# Altium schematic sheet USB_OTG.SchDoc (part 2 of 4)
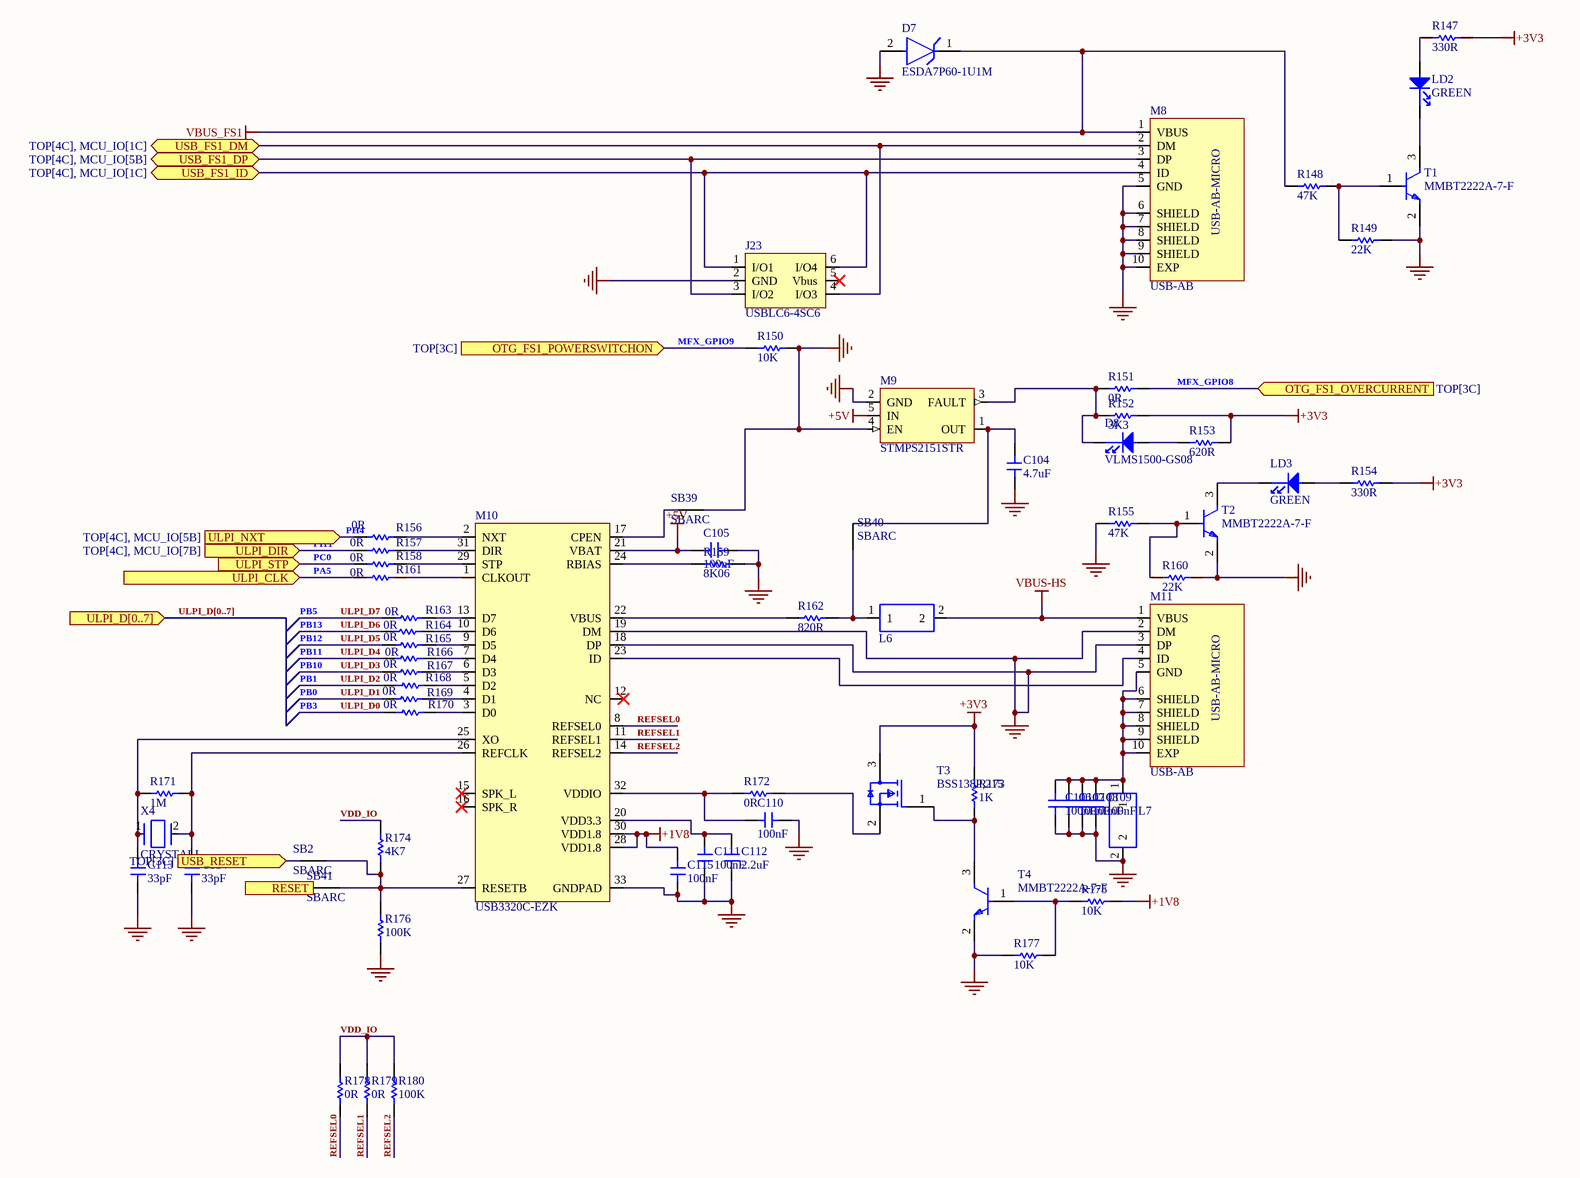
[diagram p1: USB_OTG.SchDoc]
## Library data of the parts
C104 = CL05A475MO5NUNC: 16V 4.7uF X5R 卤20% 0402 Multilayer Ceramic Capacitors MLCC - SMD/SMT ROHS; Manufacturer: Samsung Electro-Mechanics; Value: 4.7µF; Tolerance: 20%; Supplier: DigiKey; Supplier Part Number: 1276-6836-6-ND; Manufacturer Part Number: CL05A475MO5NUNC; RoHS: Compliant; Category: Ceramic Capacitors; Stock: 1005448; Pricing: 1=0.43, 10=0.26, 50=0.1918, 100=0.1709, 500=0.13574 (USD); Case/Package: 0402; Case Code (Imperial): 0402; Case Code (Metric): 1005; China RoHS: Compliant; Dielectric: X5R; Dielectric Material: Ceramic; Height: 500µm; Length: 1mm; Lifecycle Status: Production; Material: Ceramic; Max Operating Temperature: 85°C; Min Operating Temperature: -55°C; Mounting Technology: Surface Mount; Number of Terminals: 2; REACH SVHC: Yes; Schedule B: 8532240020, 8532240020|8532240020, 8532240020|8532240020|8532240020, 8532240020|8532240020|8532240020|8532240020; Thickness: 558.8µm; Voltage Rating: 16V; Voltage Rating (DC): 16V; Width: 500µm; ComponentLink1URL: https://datasheet.octopart.com:443/CL05A475MO5NUNC-Samsung-Electro-Mechanics-datasheet-178175196.pdf?src-supplier=Farnell; ComponentLink1Description: https://datasheet.octopart.com:443/CL05A475MO5NUNC-Samsung-Electro-Mechanics-datasheet-178175196.pdf?src-supplier=Farnell; ComponentLink2URL: https://datasheet.octopart.com:443/CL05A475MO5NUNC-Samsung-Electro-Mechanics-datasheet-123102911.pdf?src-supplier=Future+Electronics; ComponentLink2Description: https://datasheet.octopart.com:443/CL05A475MO5NUNC-Samsung-Electro-Mechanics-datasheet-123102911.pdf?src-supplier=Future+Electronics; ComponentLink3URL: https://datasheet.octopart.com:443/CL05A475MO5NUNC-Samsung-Electro-Mechanics-datasheet-110226225.pdf?src-supplier=Future+Electronics; ComponentLink3Description: https://datasheet.octopart.com:443/CL05A475MO5NUNC-Samsung-Electro-Mechanics-datasheet-110226225.pdf?src-supplier=Future+Electronics; ComponentLink4URL: https://datasheet.octopart.com:443/CL05A475MO5NUNC-Samsung-Electro-Mechanics-datasheet-83567908.pdf?src-supplier=Future+Electronics; ComponentLink4Description: https://datasheet.octopart.com:443/CL05A475MO5NUNC-Samsung-Electro-Mechanics-datasheet-83567908.pdf?src-supplier=Future+Electronics; ComponentLink5URL: https://datasheet.octopart.com:443/CL05A475MO5NUNC-Samsung-Electro-Mechanics-datasheet-68297032.pdf?src-supplier=Future+Electronics; ComponentLink5Description: https://datasheet.octopart.com:443/CL05A475MO5NUNC-Samsung-Electro-Mechanics-datasheet-68297032.pdf?src-supplier=Future+Electronics; ComponentLink6URL: https://datasheet.octopart.com:443/CL05A475MO5NUNC-Samsung-Electro-Mechanics-datasheet-87580057.pdf?src-supplier=Future+Electronics; ComponentLink6Description: https://datasheet.octopart.com:443/CL05A475MO5NUNC-Samsung-Electro-Mechanics-datasheet-87580057.pdf?src-supplier=Future+Electronics; ComponentLink7URL: https://datasheet.octopart.com:443/CL05A475MO5NUNC-Samsung-Electro-Mechanics-datasheet-149136694.pdf?src-supplier=Future+Electronics; ComponentLink7Description: https://datasheet.octopart.com:443/CL05A475MO5NUNC-Samsung-Electro-Mechanics-datasheet-149136694.pdf?src-supplier=Future+Electronics
C105-C111 C115 = CC0402KRX7R7BB104: 16V 100nF X7R ±10% 0402 Multilayer Ceramic Capacitors MLCC - SMD/SMT ROHS; Manufacturer: Yageo Group; Temperature Coefficient: 30ppm/°C; Supplier: DigiKey; Supplier Part Number: 311-1338-6-ND; Manufacturer Part Number: CC0402KRX7R7BB104; RoHS: Compliant; Category: Ceramic Capacitors; Stock: 6066978; Pricing: 1=0.1, 10=0.034, 50=0.0224, 100=0.0191, 500=0.01342 (USD); Value: 100nF; Case/Package: 0402; Case Code (Imperial): 0402; Case Code (Metric): 1005; China RoHS: Compliant; Composition: Ceramic; Country of Origin: Mainland China, Taiwan; Depth: 500µm; Dielectric: X7R; Dielectric Material: Ceramic; Export Control Classification Number (ECCN) Code: EAR99; Halogen Free: Halogen Free; Height: 500µm; Harmonized Tariff Schedule (HTS) Code: 8532.24.00.20; Introduction Date: 2009-04-17; Lead Free: Lead Free; Length: 1mm; Lifecycle Status: Production; Material: Ceramic; Max Operating Temperature: 125°C; Min Operating Temperature: -55°C; Mounting Technology: Surface Mount; Pins: 2; Number of Terminals: 2; Radiation Hardening: No; REACH SVHC: Yes; Schedule B: 8532240020, 8532240020|8532240020, 8532240020|8532240020|8532240020, 8532240020|8532240020|8532240020|8532240020; Termination: SMD/SMT; Thickness: 558.8µm; Tolerance: 10%; Voltage: 16V; Voltage Rating: 16V; Voltage Rating (AC): 16V; Voltage Rating (DC): 16V; Width: 500µm; ComponentLink1URL: https://datasheet.octopart.com:443/CC0402KRX7R7BB104-Yageo-datasheet-177165144.pdf?src-supplier=IHS; ComponentLink1Description: https://datasheet.octopart.com:443/CC0402KRX7R7BB104-Yageo-datasheet-177165144.pdf?src-supplier=IHS; ComponentLink2URL: https://datasheet.octopart.com/CC0402KRX7R7BB104-Yageo-datasheet-10883670.pdf; ComponentLink2Description: https://datasheet.octopart.com/CC0402KRX7R7BB104-Yageo-datasheet-10883670.pdf; ComponentLink3URL: https://datasheet.octopart.com/CC0402KRX7R7BB104-Yageo-datasheet-12526321.pdf; ComponentLink3Description: https://datasheet.octopart.com/CC0402KRX7R7BB104-Yageo-datasheet-12526321.pdf; ComponentLink4URL: https://datasheet.octopart.com:443/CC0402KRX7R7BB104-Yageo-datasheet-82288757.pdf?src-supplier=Upverter; ComponentLink4Description: https://datasheet.octopart.com:443/CC0402KRX7R7BB104-Yageo-datasheet-82288757.pdf?src-supplier=Upverter; ComponentLink5URL: https://datasheet.octopart.com:443/CC0402KRX7R7BB104-Yageo-datasheet-78855684.pdf?src-supplier=Upverter; ComponentLink5Description: https://datasheet.octopart.com:443/CC0402KRX7R7BB104-Yageo-datasheet-78855684.pdf?src-supplier=Upverter; ComponentLink6URL: https://datasheet.octopart.com:443/CC0402KRX7R7BB104-Yageo-datasheet-68298032.pdf?src-supplier=Upverter; ComponentLink6Description: https://datasheet.octopart.com:443/CC0402KRX7R7BB104-Yageo-datasheet-68298032.pdf?src-supplier=Upverter; ComponentLink7URL: https://datasheet.octopart.com:443/CC0402KRX7R7BB104-Yageo-datasheet-181967370.pdf?src-supplier=Newark; ComponentLink7Description: https://datasheet.octopart.com:443/CC0402KRX7R7BB104-Yageo-datasheet-181967370.pdf?src-supplier=Newark; ComponentLink8URL: https://datasheet.octopart.com:443/CC0402KRX7R7BB104-Yageo-datasheet-181967368.pdf?src-supplier=Newark; ComponentLink8Description: https://datasheet.octopart.com:443/CC0402KRX7R7BB104-Yageo-datasheet-181967368.pdf?src-supplier=Newark; ComponentLink9URL: https://datasheet.octopart.com:443/CC0402KRX7R7BB104-Yageo-datasheet-499490.pdf?src-supplier=Newark; ComponentLink9Description: https://datasheet.octopart.com:443/CC0402KRX7R7BB104-Yageo-datasheet-499490.pdf?src-supplier=Newark; ComponentLink10URL: https://datasheet.octopart.com:443/CC0402KRX7R7BB104-Yageo-datasheet-519481.pdf?src-supplier=Newark; ComponentLink10Description: https://datasheet.octopart.com:443/CC0402KRX7R7BB104-Yageo-datasheet-519481.pdf?src-supplier=Newark; ComponentLink11URL: https://datasheet.octopart.com:443/CC0402KRX7R7BB104-Yageo-datasheet-182050774.pdf?src-supplier=Newark; ComponentLink11Description: https://datasheet.octopart.com:443/CC0402KRX7R7BB104-Yageo-datasheet-182050774.pdf?src-supplier=Newark; ComponentLink12URL: https://datasheet.octopart.com:443/CC0402KRX7R7BB104-Yageo-datasheet-62336348.pdf?src-supplier=Farnell; ComponentLink12Description: https://datasheet.octopart.com:443/CC0402KRX7R7BB104-Yageo-datasheet-62336348.pdf?src-supplier=Farnell; ComponentLink13URL: https://datasheet.octopart.com:443/CC0402KRX7R7BB104-Yageo-datasheet-151948686.pdf?src-supplier=Farnell; ComponentLink13Description: https://datasheet.octopart.com:443/CC0402KRX7R7BB104-Yageo-datasheet-151948686.pdf?src-supplier=Farnell; ComponentLink14URL: https://datasheet.octopart.com:443/CC0402KRX7R7BB104-Yageo-Group-datasheet-188689702.pdf?src-supplier=Farnell; ComponentLink14Description: https://datasheet.octopart.com:443/CC0402KRX7R7BB104-Yageo-Group-datasheet-188689702.pdf?src-supplier=Farnell; ComponentLink15URL: https://datasheet.octopart.com:443/CC0402KRX7R7BB104-Yageo-datasheet-8359971.pdf?src-supplier=Farnell; ComponentLink15Description: https://datasheet.octopart.com:443/CC0402KRX7R7BB104-Yageo-datasheet-8359971.pdf?src-supplier=Farnell; ComponentLink16URL: https://datasheet.octopart.com:443/CC0402KRX7R7BB104-Yageo-datasheet-500777.pdf?src-supplier=Farnell; ComponentLink16Description: https://datasheet.octopart.com:443/CC0402KRX7R7BB104-Yageo-datasheet-500777.pdf?src-supplier=Farnell; ComponentLink17URL: https://datasheet.octopart.com:443/CC0402KRX7R7BB104-Yageo-datasheet-137700084.pdf?src-supplier=Burklin+Elektronik; ComponentLink17Description: https://datasheet.octopart.com:443/CC0402KRX7R7BB104-Yageo-datasheet-137700084.pdf?src-supplier=Burklin+Elektronik; ComponentLink18URL: https://datasheet.octopart.com:443/CC0402KRX7R7BB104-Yageo-datasheet-27626582.pdf?src-supplier=Future+Electronics; ComponentLink18Description: https://datasheet.octopart.com:443/CC0402KRX7R7BB104-Yageo-datasheet-27626582.pdf?src-supplier=Future+Electronics; ComponentLink19URL: https://datasheet.octopart.com:443/CC0402KRX7R7BB104-Yageo-datasheet-166511530.pdf?src-supplier=Future+Electronics; ComponentLink19Description: https://datasheet.octopart.com:443/CC0402KRX7R7BB104-Yageo-datasheet-166511530.pdf?src-supplier=Future+Electronics; ComponentLink20URL: https://datasheet.octopart.com:443/CC0402KRX7R7BB104-Yageo-datasheet-137700082.pdf?src-supplier=Future+Electronics; ComponentLink20Description: https://datasheet.octopart.com:443/CC0402KRX7R7BB104-Yageo-datasheet-137700082.pdf?src-supplier=Future+Electronics; ComponentLink21URL: https://datasheet.octopart.com:443/CC0402KRX7R7BB104-Yageo-datasheet-24578986.pdf?src-supplier=Future+Electronics; ComponentLink21Description: https://datasheet.octopart.com:443/CC0402KRX7R7BB104-Yageo-datasheet-24578986.pdf?src-supplier=Future+Electronics; ComponentLink22URL: https://datasheet.octopart.com:443/CC0402KRX7R7BB104-Yageo-datasheet-10911834.pdf?src-supplier=Future+Electronics; ComponentLink22Description: https://datasheet.octopart.com:443/CC0402KRX7R7BB104-Yageo-datasheet-10911834.pdf?src-supplier=Future+Electronics; ComponentLink23URL: https://datasheet.octopart.com:443/CC0402KRX7R7BB104-Yageo-datasheet-8324442.pdf?src-supplier=Future+Electronics; ComponentLink23Description: https://datasheet.octopart.com:443/CC0402KRX7R7BB104-Yageo-datasheet-8324442.pdf?src-supplier=Future+Electronics; ComponentLink24URL: https://datasheet.octopart.com:443/CC0402KRX7R7BB104-Yageo-datasheet-15895757.pdf?src-supplier=element14+APAC; ComponentLink24Description: https://datasheet.octopart.com:443/CC0402KRX7R7BB104-Yageo-datasheet-15895757.pdf?src-supplier=element14+APAC; ComponentLink25URL: https://datasheet.octopart.com:443/CC0402KRX7R7BB104-Yageo-Group-datasheet-184163374.pdf?src-supplier=LCSC; ComponentLink25Description: https://datasheet.octopart.com:443/CC0402KRX7R7BB104-Yageo-Group-datasheet-184163374.pdf?src-supplier=LCSC; ComponentLink26URL: https://datasheet.octopart.com:443/CC0402KRX7R7BB104-Yageo-Group-datasheet-165992755.pdf?src-supplier=ODG+(Origin+Data+Global); ComponentLink26Description: https://datasheet.octopart.com:443/CC0402KRX7R7BB104-Yageo-Group-datasheet-165992755.pdf?src-supplier=ODG+(Origin+Data+Global); ComponentLink27URL: https://datasheet.octopart.com:443/CC0402KRX7R7BB104-Yageo-datasheet-140260305.pdf?src-supplier=SOS+electronic; ComponentLink27Description: https://datasheet.octopart.com:443/CC0402KRX7R7BB104-Yageo-datasheet-140260305.pdf?src-supplier=SOS+electronic; ComponentLink28URL: https://datasheet.octopart.com:443/CC0402KRX7R7BB104-Yageo-datasheet-151978998.pdf?src-supplier=SOS+electronic; ComponentLink28Description: https://datasheet.octopart.com:443/CC0402KRX7R7BB104-Yageo-datasheet-151978998.pdf?src-supplier=SOS+electronic; ComponentLink29URL: https://datasheet.octopart.com:443/CC0402KRX7R7BB104-Yageo-datasheet-8701427.pdf?src-supplier=element14; ComponentLink29Description: https://datasheet.octopart.com:443/CC0402KRX7R7BB104-Yageo-datasheet-8701427.pdf?src-supplier=element14; ComponentLink30URL: https://datasheet.octopart.com:443/CC0402KRX7R7BB104-Yageo-datasheet-5301394.pdf?src-supplier=element14; ComponentLink30Description: https://datasheet.octopart.com:443/CC0402KRX7R7BB104-Yageo-datasheet-5301394.pdf?src-supplier=element14; ComponentLink31URL: http://sigma.octopart.com:80/rohs_statement/Surface-Mount-Ceramic-Multilayer-Capacitors%3B-General-Purpose-%26-High-Capacitance-Class-2%2C-X7R-Yageo-family-124.pdf?src-supplier=Compliance+Statements; ComponentLink31Description: http://sigma.octopart.com:80/rohs_statement/Surface-Mount-Ceramic-Multilayer-Capacitors%3B-General-Purpose-%26-High-Capacitance-Class-2%2C-X7R-Yageo-family-124.pdf?src-supplier=Compliance+Statements; ComponentLink32URL: http://sigma.octopart.com:80/reach_statement/Surface-Mount-Ceramic-Multilayer-Capacitors%3B-General-Purpose-%26-High-Capacitance-Class-2%2C-X7R-Yageo-family-125.pdf?src-supplier=Compliance+Statements; ComponentLink32Description: http://sigma.octopart.com:80/reach_statement/Surface-Mount-Ceramic-Multilayer-Capacitors%3B-General-Purpose-%26-High-Capacitance-Class-2%2C-X7R-Yageo-family-125.pdf?src-supplier=Compliance+Statements; ComponentLink33URL: http://sigma.octopart.com:80/conflict_mineral_statement/Yageo-company-3.pdf?src-supplier=Compliance+Statements; ComponentLink33Description: http://sigma.octopart.com:80/conflict_mineral_statement/Yageo-company-3.pdf?src-supplier=Compliance+Statements; ComponentLink34URL: http://sigma.octopart.com:80/rohs_statement/Yageo-company-2.pdf?src-supplier=Compliance+Statements; ComponentLink34Description: http://sigma.octopart.com:80/rohs_statement/Yageo-company-2.pdf?src-supplier=Compliance+Statements
C112 = CC1206KKX7R7BB225: Surface Mount Ceramic Multilayer Capacitor 2.2uF 10% X7R 16V 1206 Blister T/R; Manufacturer: Yageo Group; Value: 2.2µF; Supplier: DigiKey; Supplier Part Number: 311-1957-1-ND; Manufacturer Part Number: CC1206KKX7R7BB225; RoHS: Compliant; Category: Ceramic Capacitors; Stock: 35949; Pricing: 1=0.38, 10=0.221, 50=0.1606, 100=0.1421, 500=0.11082 (USD); Case/Package: 1206; Case Code (Imperial): 1206; Case Code (Metric): 3216; China RoHS: Compliant; Depth: 1.6mm; Dielectric: X7R; Dielectric Material: Ceramic; Halogen Free: Halogen Free; Height: 1.15mm; Lead Free: Lead Free; Length: 3.2mm; Lifecycle Status: Production; Material: Ceramic; Max Operating Temperature: 125°C; Min Operating Temperature: -55°C; Mounting Technology: Surface Mount; Pins: 2; Number of Terminals: 2; Packaging: Tape and Reel; Radiation Hardening: No; REACH SVHC: Yes; Schedule B: 8532240020, 8532240020|8532240020|8532240020|8532240020|8532240020; Termination: SMD/SMT; Thickness: 1.2446mm; Tolerance: 10%; Voltage: 16V; Voltage Rating: 16V; Voltage Rating (DC): 16V; Width: 1.6mm; ComponentLink1URL: https://datasheet.octopart.com:443/CC1206KKX7R7BB225-Yageo-datasheet-177165144.pdf?src-supplier=IHS; ComponentLink1Description: https://datasheet.octopart.com:443/CC1206KKX7R7BB225-Yageo-datasheet-177165144.pdf?src-supplier=IHS; ComponentLink2URL: https://datasheet.octopart.com:443/CC1206KKX7R7BB225-Yageo-datasheet-116051370.pdf?src-supplier=Upverter; ComponentLink2Description: https://datasheet.octopart.com:443/CC1206KKX7R7BB225-Yageo-datasheet-116051370.pdf?src-supplier=Upverter; ComponentLink3URL: https://datasheet.octopart.com:443/CC1206KKX7R7BB225-Yageo-datasheet-82288757.pdf?src-supplier=Upverter; ComponentLink3Description: https://datasheet.octopart.com:443/CC1206KKX7R7BB225-Yageo-datasheet-82288757.pdf?src-supplier=Upverter; ComponentLink4URL: https://datasheet.octopart.com:443/CC1206KKX7R7BB225-Yageo-datasheet-147453679.pdf?src-supplier=Farnell; ComponentLink4Description: https://datasheet.octopart.com:443/CC1206KKX7R7BB225-Yageo-datasheet-147453679.pdf?src-supplier=Farnell; ComponentLink5URL: https://datasheet.octopart.com:443/CC1206KKX7R7BB225-Yageo-datasheet-181970700.pdf?src-supplier=Farnell; ComponentLink5Description: https://datasheet.octopart.com:443/CC1206KKX7R7BB225-Yageo-datasheet-181970700.pdf?src-supplier=Farnell; ComponentLink6URL: https://datasheet.octopart.com:443/CC1206KKX7R7BB225-Yageo-datasheet-140260305.pdf?src-supplier=element14+APAC; ComponentLink6Description: https://datasheet.octopart.com:443/CC1206KKX7R7BB225-Yageo-datasheet-140260305.pdf?src-supplier=element14+APAC; ComponentLink7URL: https://datasheet.octopart.com/CC1206KKX7R7BB225-Yageo-datasheet-12526321.pdf; ComponentLink7Description: https://datasheet.octopart.com/CC1206KKX7R7BB225-Yageo-datasheet-12526321.pdf; ComponentLink8URL: https://datasheet.octopart.com/CC1206KKX7R7BB225-Yageo-datasheet-10883670.pdf; ComponentLink8Description: https://datasheet.octopart.com/CC1206KKX7R7BB225-Yageo-datasheet-10883670.pdf; ComponentLink9URL: https://datasheet.octopart.com:443/CC1206KKX7R7BB225-Yageo-Group-datasheet-189192896.pdf?src-supplier=Future+Electronics; ComponentLink9Description: https://datasheet.octopart.com:443/CC1206KKX7R7BB225-Yageo-Group-datasheet-189192896.pdf?src-supplier=Future+Electronics; ComponentLink10URL: https://datasheet.octopart.com:443/CC1206KKX7R7BB225-Yageo-datasheet-166511530.pdf?src-supplier=Future+Electronics; ComponentLink10Description: https://datasheet.octopart.com:443/CC1206KKX7R7BB225-Yageo-datasheet-166511530.pdf?src-supplier=Future+Electronics; ComponentLink11URL: https://datasheet.octopart.com:443/CC1206KKX7R7BB225-Yageo-datasheet-137700082.pdf?src-supplier=Future+Electronics; ComponentLink11Description: https://datasheet.octopart.com:443/CC1206KKX7R7BB225-Yageo-datasheet-137700082.pdf?src-supplier=Future+Electronics; ComponentLink12URL: https://datasheet.octopart.com:443/CC1206KKX7R7BB225-Yageo-datasheet-137700084.pdf?src-supplier=Future+Electronics; ComponentLink12Description: https://datasheet.octopart.com:443/CC1206KKX7R7BB225-Yageo-datasheet-137700084.pdf?src-supplier=Future+Electronics; ComponentLink13URL: https://datasheet.octopart.com:443/CC1206KKX7R7BB225-Yageo-datasheet-27626582.pdf?src-supplier=Future+Electronics; ComponentLink13Description: https://datasheet.octopart.com:443/CC1206KKX7R7BB225-Yageo-datasheet-27626582.pdf?src-supplier=Future+Electronics; ComponentLink14URL: https://datasheet.octopart.com:443/CC1206KKX7R7BB225-Yageo-datasheet-15895757.pdf?src-supplier=Future+Electronics; ComponentLink14Description: https://datasheet.octopart.com:443/CC1206KKX7R7BB225-Yageo-datasheet-15895757.pdf?src-supplier=Future+Electronics; ComponentLink15URL: https://datasheet.octopart.com:443/CC1206KKX7R7BB225-Yageo-datasheet-10911834.pdf?src-supplier=Future+Electronics; ComponentLink15Description: https://datasheet.octopart.com:443/CC1206KKX7R7BB225-Yageo-datasheet-10911834.pdf?src-supplier=Future+Electronics; ComponentLink16URL: https://datasheet.octopart.com:443/CC1206KKX7R7BB225-Yageo-datasheet-12523175.pdf?src-supplier=Future+Electronics; ComponentLink16Description: https://datasheet.octopart.com:443/CC1206KKX7R7BB225-Yageo-datasheet-12523175.pdf?src-supplier=Future+Electronics; ComponentLink17URL: https://datasheet.octopart.com:443/CC1206KKX7R7BB225-Yageo-datasheet-8324442.pdf?src-supplier=Future+Electronics; ComponentLink17Description: https://datasheet.octopart.com:443/CC1206KKX7R7BB225-Yageo-datasheet-8324442.pdf?src-supplier=Future+Electronics; ComponentLink18URL: https://datasheet.octopart.com:443/CC1206KKX7R7BB225-Yageo-Group-datasheet-184163374.pdf?src-supplier=LCSC; ComponentLink18Description: https://datasheet.octopart.com:443/CC1206KKX7R7BB225-Yageo-Group-datasheet-184163374.pdf?src-supplier=LCSC; ComponentLink19URL: https://datasheet.octopart.com:443/CC1206KKX7R7BB225-Yageo-Group-datasheet-165992755.pdf?src-supplier=ODG+(Origin+Data+Global); ComponentLink19Description: https://datasheet.octopart.com:443/CC1206KKX7R7BB225-Yageo-Group-datasheet-165992755.pdf?src-supplier=ODG+(Origin+Data+Global); ComponentLink20URL: https://datasheet.octopart.com:443/CC1206KKX7R7BB225-Yageo-datasheet-151948686.pdf?src-supplier=TME; ComponentLink20Description: https://datasheet.octopart.com:443/CC1206KKX7R7BB225-Yageo-datasheet-151948686.pdf?src-supplier=TME; ComponentLink21URL: https://datasheet.octopart.com:443/CC1206KKX7R7BB225-Yageo-datasheet-17600895.pdf?src-supplier=TME; ComponentLink21Description: https://datasheet.octopart.com:443/CC1206KKX7R7BB225-Yageo-datasheet-17600895.pdf?src-supplier=TME; ComponentLink22URL: https://datasheet.octopart.com:443/CC1206KKX7R7BB225-Yageo-datasheet-62336348.pdf?src-supplier=Newark; ComponentLink22Description: https://datasheet.octopart.com:443/CC1206KKX7R7BB225-Yageo-datasheet-62336348.pdf?src-supplier=Newark; ComponentLink23URL: http://sigma.octopart.com:80/rohs_statement/Surface-Mount-Ceramic-Multilayer-Capacitors%3B-General-Purpose-%26-High-Capacitance-Class-2%2C-X7R-Yageo-family-124.pdf?src-supplier=Compliance+Statements; ComponentLink23Description: http://sigma.octopart.com:80/rohs_statement/Surface-Mount-Ceramic-Multilayer-Capacitors%3B-General-Purpose-%26-High-Capacitance-Class-2%2C-X7R-Yageo-family-124.pdf?src-supplier=Compliance+Statements; ComponentLink24URL: http://sigma.octopart.com:80/reach_statement/Surface-Mount-Ceramic-Multilayer-Capacitors%3B-General-Purpose-%26-High-Capacitance-Class-2%2C-X7R-Yageo-family-125.pdf?src-supplier=Compliance+Statements; ComponentLink24Description: http://sigma.octopart.com:80/reach_statement/Surface-Mount-Ceramic-Multilayer-Capacitors%3B-General-Purpose-%26-High-Capacitance-Class-2%2C-X7R-Yageo-family-125.pdf?src-supplier=Compliance+Statements; ComponentLink25URL: http://sigma.octopart.com:80/conflict_mineral_statement/Yageo-company-3.pdf?src-supplier=Compliance+Statements; ComponentLink25Description: http://sigma.octopart.com:80/conflict_mineral_statement/Yageo-company-3.pdf?src-supplier=Compliance+Statements; ComponentLink26URL: http://sigma.octopart.com:80/rohs_statement/Yageo-company-2.pdf?src-supplier=Compliance+Statements; ComponentLink26Description: http://sigma.octopart.com:80/rohs_statement/Yageo-company-2.pdf?src-supplier=Compliance+Statements
C113 C114 = 0402YK330FBSTR\500: Cap Silicon 33pF 16V 0±60ppm/C 1% SMD 0402 125C Automotive T/R; Manufacturer: KYOCERA AVX; Material: Ceramic; Temperature Coefficient: 60ppm/°C; Supplier: DigiKey; Supplier Part Number: 478-12128-6-ND; Manufacturer Part Number: 0402YK330FBSTR\500; RoHS: Compliant; Category: Film Capacitors; Stock: 15880; Pricing: 1=1.05, 10=0.676, 50=0.527, 100=0.4811 (USD); Value: 33pF; Case/Package: 0402; China RoHS: Compliant; Height: 400µm; Length: 1mm; Lifecycle Status: Production; Max Operating Temperature: 125°C; Min Operating Temperature: -55°C; Mounting Technology: Surface Mount; Number of Terminals: 2; REACH SVHC: Yes; Schedule B: 8532290040, 8532290040|8532290040|8532290040|8532290040|8532290040; Tolerance: 1%; Voltage Rating: 16V; Voltage Rating (DC): 16V; Width: 550µm; ComponentLink1URL: https://datasheet.octopart.com:443/0402YK330FBSTR%5C500-KYOCERA-AVX-datasheet-158242086.pdf?src-supplier=IHS; ComponentLink1Description: https://datasheet.octopart.com:443/0402YK330FBSTR%5C500-KYOCERA-AVX-datasheet-158242086.pdf?src-supplier=IHS; ComponentLink2URL: https://datasheet.octopart.com:443/0402YK330FBSTR%5C500-AVX-datasheet-152583363.pdf?src-supplier=Upverter; ComponentLink2Description: https://datasheet.octopart.com:443/0402YK330FBSTR%5C500-AVX-datasheet-152583363.pdf?src-supplier=Upverter; ComponentLink3URL: http://sigma.octopart.com:80/conflict_mineral_statement/AVX-company-34.pdf?src-supplier=Compliance+Statements; ComponentLink3Description: http://sigma.octopart.com:80/conflict_mineral_statement/AVX-company-34.pdf?src-supplier=Compliance+Statements; ComponentLink4URL: http://sigma.octopart.com:80/reach_statement/AVX-company-19.pdf?src-supplier=Compliance+Statements; ComponentLink4Description: http://sigma.octopart.com:80/reach_statement/AVX-company-19.pdf?src-supplier=Compliance+Statements
D7 = ESDA7P60-1U1M: ESDA Series 6.4 V 700 W SMT Uni-Directional TVS Diode - 1610; Manufacturer: STMicroelectronics; Breakdown Voltage: 6.8V; Clamping Voltage: 11.6V; Direction: Unidirectional; Max Breakdown Voltage: 7.2V; Max Junction Temperature (Tj): 150°C; Min Breakdown Voltage: 6.4V; Number of Channels: 1; Peak Pulse Current: 60A; Peak Pulse Power: 700W; Peak Reverse Current: 200nA; Power Line Protection: No; Reverse Standoff Voltage: 5V; Supplier: DigiKey; Supplier Part Number: 497-16253-6-ND; Manufacturer Part Number: ESDA7P60-1U1M; RoHS: Compliant; Category: TVS Diodes; Stock: 60851; Pricing: 1=0.54, 10=0.33, 50=0.2392, 100=0.2096, 500=0.15722 (USD); Case/Package: 1610; China RoHS: Compliant; Composition: Zener; Country of Origin: Mainland China; Export Control Classification Number (ECCN) Code: EAR99; Height: 650µm; Harmonized Tariff Schedule (HTS) Code: 8541.10.00.50; Introduction Date: 2014-11-14; Lifecycle Status: Production; Max Operating Temperature: 150°C; Min Operating Temperature: -55°C; Mounting Technology: Surface Mount; Number of Elements: 1; Pins: 2; Number of Terminals: 2; Number of Unidirectional Channels: 1; Polarity: Unidirectional; REACH SVHC: Yes; Schedule B: 8536300000, 8536300000|8536300000, 8536300000|8536300000|8536300000, 8536300000|8536300000|8536300000|8536300000; ComponentLink1URL: https://datasheet.octopart.com:443/ESDA7P60-1U1M-STMicroelectronics-datasheet-62313013.pdf?src-supplier=Upverter; ComponentLink1Description: https://datasheet.octopart.com:443/ESDA7P60-1U1M-STMicroelectronics-datasheet-62313013.pdf?src-supplier=Upverter; ComponentLink2URL: https://datasheet.octopart.com:443/ESDA7P60-1U1M-STMicroelectronics-datasheet-34136856.pdf?src-supplier=STMicroelectronics; ComponentLink2Description: https://datasheet.octopart.com:443/ESDA7P60-1U1M-STMicroelectronics-datasheet-34136856.pdf?src-supplier=STMicroelectronics
D8 = VLMS1500-GS08: LED Uni-Color Super Red 639nm 2-Pin Chip 0402(1006Metric) T/R
J23 = USBLC6-4SC6: STMicroelectronics USBLC6-4SC6 Diode TVS USBLC6-4SC6 Tape Reel Surge Protection; Breakdown Voltage: 8V; Value: 3pF; Clamping Voltage: 17V; Direction: Unidirectional; ESD Protection: Yes; Forward Voltage: 860mV; Interface: Ethernet, USB; Leakage Current: 150nA; Max Breakdown Voltage: 10V; Max Junction Temperature (Tj): 125°C; Max Reverse Leakage Current: 2µA; Min Breakdown Voltage: 6V; Number of Bidirectional Channels: 4; Number of Elements: 1; Peak Pulse Current: 5A; Peak Pulse Power: 130W; Reverse Standoff Voltage: 5V; Test Current: 1mA; Supplier: DigiKey; Supplier Part Number: 497-4492-2-ND; Manufacturer: STMicroelectronics; Manufacturer Part Number: USBLC6-4SC6; RoHS: Compliant; Category: TVS Diodes; Stock: 34382; Pricing: 3000=0.13528, 9000=0.11686 (USD); Case/Package: SOT-23; China RoHS: Compliant; Contact Plating: Tin; Depth: 1.75mm; Height: 1.45mm; Lead Free: Lead Free; Length: 3mm; Lifecycle Status: Production; Max Operating Temperature: 125°C; Min Operating Temperature: -40°C; Mounting Technology: Surface Mount; Number of Channels: 4; Pins: 6; Number of Terminals: 6; Operating Supply Voltage: 860mV; Packaging: Cut Tape; Peak Reverse Current: 150nA; Polarity: Unidirectional; Power Line Protection: Yes; Radiation Hardening: No; REACH SVHC: Yes; Reverse Breakdown Voltage: 6V; Schedule B: 8536300000, 8536300000|8536300000|8536300000|8536300000|8536300000; Termination: SMD/SMT; Voltage Rating (DC): 5V; Weight: 4.535924g; Width: 1.75mm; Working Voltage: 5V; ComponentLink1URL: https://datasheet.octopart.com:443/USBLC6-4SC6-STMicroelectronics-datasheet-10411966.pdf?src-supplier=Upverter; ComponentLink1Description: https://datasheet.octopart.com:443/USBLC6-4SC6-STMicroelectronics-datasheet-10411966.pdf?src-supplier=Upverter; ComponentLink2URL: https://datasheet.octopart.com:443/USBLC6-4SC6-STMicroelectronics-datasheet-58295097.pdf?src-supplier=Future+Electronics; ComponentLink2Description: https://datasheet.octopart.com:443/USBLC6-4SC6-STMicroelectronics-datasheet-58295097.pdf?src-supplier=Future+Electronics; ComponentLink3URL: https://datasheet.octopart.com:443/USBLC6-4SC6-STMicroelectronics-datasheet-5415472.pdf?src-supplier=Factory+Futures; ComponentLink3Description: https://datasheet.octopart.com:443/USBLC6-4SC6-STMicroelectronics-datasheet-5415472.pdf?src-supplier=Factory+Futures; ComponentLink4URL: https://datasheet.octopart.com:443/USBLC6-4SC6-STMicroelectronics-datasheet-93958.pdf?src-supplier=Nu+Horizons; ComponentLink4Description: https://datasheet.octopart.com:443/USBLC6-4SC6-STMicroelectronics-datasheet-93958.pdf?src-supplier=Nu+Horizons; ComponentLink5URL: https://datasheet.octopart.com:443/USBLC6-4SC6-STMicroelectronics-datasheet-14050649.pdf?src-supplier=iiiC; ComponentLink5Description: https://datasheet.octopart.com:443/USBLC6-4SC6-STMicroelectronics-datasheet-14050649.pdf?src-supplier=iiiC; ComponentLink6URL: https://datasheet.octopart.com:443/USBLC6-4SC6-STMicroelectronics-datasheet-8428582.pdf?src-supplier=Jameco+(USA); ComponentLink6Description: https://datasheet.octopart.com:443/USBLC6-4SC6-STMicroelectronics-datasheet-8428582.pdf?src-supplier=Jameco+(USA); ComponentLink7URL: https://datasheet.octopart.com:443/USBLC6-4SC6-STMicroelectronics-datasheet-46285.pdf?src-supplier=Farnell; ComponentLink7Description: https://datasheet.octopart.com:443/USBLC6-4SC6-STMicroelectronics-datasheet-46285.pdf?src-supplier=Farnell
L6 L7 = FBMJ1608HM180NTR: Ferrite Beads Power Chip 18Ohm 30% 100MHz 7.5A 0.004Ohm DCR 0603 Automotive T/R; Manufacturer: TAIYO YUDEN; DC Resistance (DCR): 4mΩ; Impedance: 18Ω; Number of Circuits: 1; Value: 4mΩ; Supplier: DigiKey; Supplier Part Number: 587-3251-6-ND; Manufacturer Part Number: FBMJ1608HM180NTR; RoHS: Compliant; Category: Ferrite Beads and Chips; Stock: 36635; Pricing: 1=0.12, 10=0.085, 25=0.0744, 50=0.0666, 100=0.0596, 250=0.05132, 500=0.04556, 1000=0.04024 (USD); Case/Package: 0603; Case Code (Imperial): 0603; Case Code (Metric): 1608; Current Rating: 7.5A; Halogen Free: Halogen Free; Height: 800µm; Length: 1.6mm; Lifecycle Status: Production; Max Current Rating: 7.5A; Max DC Current: 7.5A; Clock Frequency: 100MHz; Max Length: 1.8mm; Max Operating Temperature: 125°C; Max Thickness: 1mm; Max Width: 1mm; Min Length: 1.4mm; Min Operating Temperature: -40°C; Min Thickness: 600µm; Min Width: 600µm; Mounting Technology: Surface Mount; Number of Lines: 1; Number of Terminals: 2; Packaging: Cut Tape (CT); REACH SVHC: Yes; Termination: SMD/SMT; Test Frequency: 100MHz; Tolerance: 30%; Weight: 2.012816mg; Width: 800µm; ComponentLink1URL: https://datasheet.octopart.com:443/FBMJ1608HM180NTR-Taiyo-Yuden-datasheet-151884371.pdf?src-supplier=IHS; ComponentLink1Description: https://datasheet.octopart.com:443/FBMJ1608HM180NTR-Taiyo-Yuden-datasheet-151884371.pdf?src-supplier=IHS; ComponentLink2URL: https://datasheet.octopart.com:443/FBMJ1608HM180NTR-Taiyo-Yuden-datasheet-154808389.pdf?src-supplier=Master+Electronics; ComponentLink2Description: https://datasheet.octopart.com:443/FBMJ1608HM180NTR-Taiyo-Yuden-datasheet-154808389.pdf?src-supplier=Master+Electronics; ComponentLink3URL: https://datasheet.octopart.com:443/FBMJ1608HM180NTR-Taiyo-Yuden-datasheet-112254974.pdf?src-supplier=Newark; ComponentLink3Description: https://datasheet.octopart.com:443/FBMJ1608HM180NTR-Taiyo-Yuden-datasheet-112254974.pdf?src-supplier=Newark; ComponentLink4URL: https://datasheet.octopart.com:443/FBMJ1608HM180NTR-Taiyo-Yuden-datasheet-99833420.pdf?src-supplier=Future+Electronics; ComponentLink4Description: https://datasheet.octopart.com:443/FBMJ1608HM180NTR-Taiyo-Yuden-datasheet-99833420.pdf?src-supplier=Future+Electronics; ComponentLink5URL: https://datasheet.octopart.com/FBMJ1608HM180NTR-Taiyo-Yuden-datasheet-17272611.pdf; ComponentLink5Description: https://datasheet.octopart.com/FBMJ1608HM180NTR-Taiyo-Yuden-datasheet-17272611.pdf
LD2 LD3 = led_green: LED
M8 M11 = 105017-0001: Conn Micro USB 2.0 Type B RCP 5 POS 0.65mm Solder RA SMD 5 Terminal 1 Port Micro-USB T/R; Manufacturer: Molex; Manufacturer Lifecycle Status: ACTIVE; Connector Type: Receptacle, USB; Contact Resistance: 30mΩ; Current Rating: 2.5A; Dielectric Material: Liquid Crystal Polymer; Gender: Female; Insulation Resistance: 1GΩ; Max Voltage Rating (AC): 30V; Number of Circuits: 5; Number of Ports: 1; Pitch: 650µm; Plating: Gold; USB Standard: USB 2.0; Supplier: DigiKey; Supplier Part Number: WM1399CT-ND; Manufacturer Part Number: 105017-0001; RoHS: Compliant; Category: USB Connectors; Stock: 55178; Pricing: 1=0.92, 10=0.785, 25=0.7356, 50=0.7004, 100=0.667, 250=0.62516, 500=0.59532, 1000=0.56688 (USD); China RoHS: Compliant; Contact Material: Brass; Contact Plating: Gold; Country of Origin: US; Depth: 7.5mm; Export Control Classification Number (ECCN) Code: EAR99; Features: Shielded; Halogen Free: Low Halogen; Height: 2.825mm; Housing Material: Polymer; Harmonized Tariff Schedule (HTS) Code: 8536.69.40.30; Insulation Color: Black; Introduction Date: 2009-06-22; Length: 8.2mm; Lifecycle Status: Production; Max Operating Temperature: 85°C; Min Operating Temperature: -30°C; Mounting Technology: Cable; Number of Contacts: 5; Pins: 5; Number of Positions: 5; Number of Rows: 1; Number of Terminals: 5; Orientation: Right Angle; Radiation Hardening: No; REACH SVHC: Yes; Schedule B: 8536695050, 8536695050|8536695050, 8536695050|8536695050|8536695050, 8536695050|8536695050|8536695050|8536695050; Shell Finish: Tin; Shell Material: Stainless Steel; Terminal Pitch: 650µm; Termination: Solder; Voltage Rating: 30V; Voltage Rating (AC): 30V; ComponentLink1URL: https://datasheet.octopart.com:443/1050170001-Molex-datasheet-142335147.pdf?src-supplier=IHS; ComponentLink1Description: https://datasheet.octopart.com:443/1050170001-Molex-datasheet-142335147.pdf?src-supplier=IHS; ComponentLink2URL: https://datasheet.octopart.com:443/105017-0001-Molex-datasheet-14876665.pdf?src-supplier=Upverter; ComponentLink2Description: https://datasheet.octopart.com:443/105017-0001-Molex-datasheet-14876665.pdf?src-supplier=Upverter; ComponentLink3URL: https://datasheet.octopart.com:443/105017-0001-Molex-datasheet-10100431.pdf?src-supplier=Upverter; ComponentLink3Description: https://datasheet.octopart.com:443/105017-0001-Molex-datasheet-10100431.pdf?src-supplier=Upverter; ComponentLink4URL: https://datasheet.octopart.com:443/1050170001-Molex-datasheet-8355809.pdf?src-supplier=Upverter; ComponentLink4Description: https://datasheet.octopart.com:443/1050170001-Molex-datasheet-8355809.pdf?src-supplier=Upverter; ComponentLink5URL: https://sigma.octopart.com:443/120074112/technical_drawing/Molex-1050170001.pdf?src-supplier=Upverter; ComponentLink5Description: https://sigma.octopart.com:443/120074112/technical_drawing/Molex-1050170001.pdf?src-supplier=Upverter; ComponentLink6URL: https://datasheet.octopart.com:443/105017-0001-Molex-datasheet-13746511.pdf?src-supplier=Sager+Electronics; ComponentLink6Description: https://datasheet.octopart.com:443/105017-0001-Molex-datasheet-13746511.pdf?src-supplier=Sager+Electronics; ComponentLink7URL: https://datasheet.octopart.com:443/105017-0001-Molex-datasheet-193058816.pdf?src-supplier=JRH+Electronics; ComponentLink7Description: https://datasheet.octopart.com:443/105017-0001-Molex-datasheet-193058816.pdf?src-supplier=JRH+Electronics; ComponentLink8URL: https://datasheet.octopart.com:443/105017-0001-Molex-datasheet-154742999.pdf?src-supplier=Master+Electronics; ComponentLink8Description: https://datasheet.octopart.com:443/105017-0001-Molex-datasheet-154742999.pdf?src-supplier=Master+Electronics; ComponentLink9URL: https://datasheet.octopart.com:443/105017-0001-Molex-datasheet-77519180.pdf?src-supplier=Newark; ComponentLink9Description: https://datasheet.octopart.com:443/105017-0001-Molex-datasheet-77519180.pdf?src-supplier=Newark; ComponentLink10URL: https://datasheet.octopart.com:443/105017-0001-Molex-datasheet-66628043.pdf?src-supplier=Newark; ComponentLink10Description: https://datasheet.octopart.com:443/105017-0001-Molex-datasheet-66628043.pdf?src-supplier=Newark; ComponentLink11URL: https://datasheet.octopart.com:443/105017-0001-Molex-datasheet-32867472.pdf?src-supplier=Farnell; ComponentLink11Description: https://datasheet.octopart.com:443/105017-0001-Molex-datasheet-32867472.pdf?src-supplier=Farnell; ComponentLink12URL: https://datasheet.octopart.com:443/105017-0001-Molex-datasheet-24907595.pdf?src-supplier=Farnell; ComponentLink12Description: https://datasheet.octopart.com:443/105017-0001-Molex-datasheet-24907595.pdf?src-supplier=Farnell; ComponentLink13URL: https://datasheet.octopart.com:443/105017-0001-Molex-datasheet-140174740.pdf?src-supplier=RS+(Formerly+Allied+Electronics); ComponentLink13Description: https://datasheet.octopart.com:443/105017-0001-Molex-datasheet-140174740.pdf?src-supplier=RS+(Formerly+Allied+Electronics); ComponentLink14URL: https://datasheet.octopart.com:443/105017-0001-Molex-datasheet-120135174.pdf?src-supplier=RS+(Formerly+Allied+Electronics); ComponentLink14Description: https://datasheet.octopart.com:443/105017-0001-Molex-datasheet-120135174.pdf?src-supplier=RS+(Formerly+Allied+Electronics); ComponentLink15URL: https://datasheet.octopart.com:443/1050170001-Molex-datasheet-137316104.pdf?src-supplier=Future+Electronics; ComponentLink15Description: https://datasheet.octopart.com:443/1050170001-Molex-datasheet-137316104.pdf?src-supplier=Future+Electronics; ComponentLink16URL: https://datasheet.octopart.com:443/105017-0001-Molex-datasheet-44399914.pdf?src-supplier=Electro+Sonic; ComponentLink16Description: https://datasheet.octopart.com:443/105017-0001-Molex-datasheet-44399914.pdf?src-supplier=Electro+Sonic; ComponentLink17URL: https://datasheet.octopart.com:443/105017-0001-Molex-datasheet-41578275.pdf?src-supplier=Electro+Sonic; ComponentLink17Description: https://datasheet.octopart.com:443/105017-0001-Molex-datasheet-41578275.pdf?src-supplier=Electro+Sonic; ComponentLink18URL: https://datasheet.octopart.com:443/105017-0001-Molex-datasheet-23708332.pdf?src-supplier=Electro+Sonic; ComponentLink18Description: https://datasheet.octopart.com:443/105017-0001-Molex-datasheet-23708332.pdf?src-supplier=Electro+Sonic; ComponentLink19URL: http://sigma.octopart.com:80/16324173/rohs_statement/Molex-105017-0001.pdf?src-supplier=Compliance+Statements; ComponentLink19Description: http://sigma.octopart.com:80/16324173/rohs_statement/Molex-105017-0001.pdf?src-supplier=Compliance+Statements; ComponentLink20URL: http://sigma.octopart.com:80/reach_statement/Molex-company-74.pdf?src-supplier=Compliance+Statements; ComponentLink20Description: http://sigma.octopart.com:80/reach_statement/Molex-company-74.pdf?src-supplier=Compliance+Statements; ComponentLink21URL: http://sigma.octopart.com:80/rohs_statement/Molex-company-73.pdf?src-supplier=Compliance+Statements; ComponentLink21Description: http://sigma.octopart.com:80/rohs_statement/Molex-company-73.pdf?src-supplier=Compliance+Statements; ComponentLink22URL: http://sigma.octopart.com:80/conflict_mineral_statement/Molex-company-72.pdf?src-supplier=Compliance+Statements; ComponentLink22Description: http://sigma.octopart.com:80/conflict_mineral_statement/Molex-company-72.pdf?src-supplier=Compliance+Statements
M9 = STMPS2151STR: STMPS Series 1 Channel 5.5V 500 mA 200 mOhm High Side Power Switch - SOT-23-5; Manufacturer: STMicroelectronics; Current: 500mA; Drain to Source Resistance: 90mΩ; Fault Protection: Over Temperature, Reverse Current; Max Junction Temperature (Tj): 125°C; Max Power Dissipation: 33.8mW; Max Supply Current: 40µA; Min Input Voltage: 2.7V; Nominal Supply Voltage: 5V; Nominal Supply Current: 12µA; Number of Channels: 1; Power Dissipation: 32.5mW; Value: 90mΩ; Turn-Off Delay Time: 10ms; Turn-On Delay Time: 5ms; Supplier: DigiKey; Supplier Part Number: 497-6934-1-ND; Manufacturer Part Number: STMPS2151STR; RoHS: Compliant; Category: Power Switch ICs - Power Distribution; Pricing: 1=0.73, 10=0.517, 25=0.464, 100=0.406, 250=0.37836, 500=0.36168, 1000=0.34794 (USD); Ambient Temperature Range High: 85°C; Case/Package: LSSOP; China RoHS: Compliant; Country of Origin: Malaysia; Current Rating: 500mA; Export Control Classification Number (ECCN) Code: EAR99; Height: 1.45mm; Height - Seated (Max): 1.45mm; Harmonized Tariff Schedule (HTS) Code: 8542.39.00.60; Introduction Date: 2007-08-01; Lead Free: Lead Free; Length: 2.9mm; Lifecycle Status: Production; Max Supply Voltage: 5.5V; Max Operating Temperature: 85°C; Max Output current: 500mA; Min Operating Temperature: -40°C; Min Supply Voltage: 2.7V; Mounting Technology: Surface Mount; Nominal Supply Voltage (DC): 5V; Number of Circuits: 1; Number of Inputs: 1; Number of Outputs: 1; Pins: 5; Number of Terminals: 5; On-State Resistance: 90mΩ; Operating Supply Voltage: 5.5V; Output Configuration: High Side; Output Current: 500mA; Output Voltage: 5V; Radiation Hardening: No; REACH SVHC: Yes; Schedule B: 8542390000; Terminal Pitch: 950µm; Voltage: 5.5V; Width: 1.625mm; ComponentLink1URL: https://datasheet.octopart.com:443/STMPS2151STR-STMicroelectronics-datasheet-15207125.pdf?src-supplier=ODG+(Origin+Data+Global); ComponentLink1Description: https://datasheet.octopart.com:443/STMPS2151STR-STMicroelectronics-datasheet-15207125.pdf?src-supplier=ODG+(Origin+Data+Global); ComponentLink2URL: https://datasheet.octopart.com:443/STMPS2151STR-STMicroelectronics-datasheet-8090930.pdf?src-supplier=Factory+Futures; ComponentLink2Description: https://datasheet.octopart.com:443/STMPS2151STR-STMicroelectronics-datasheet-8090930.pdf?src-supplier=Factory+Futures; ComponentLink3URL: https://datasheet.octopart.com:443/STMPS2151STR-STMicroelectronics-datasheet-12510524.pdf?src-supplier=Factory+Futures; ComponentLink3Description: https://datasheet.octopart.com:443/STMPS2151STR-STMicroelectronics-datasheet-12510524.pdf?src-supplier=Factory+Futures; ComponentLink4URL: https://datasheet.octopart.com:443/STMPS2151STR-STMicroelectronics-datasheet-502421.pdf?src-supplier=Future+Electronics; ComponentLink4Description: https://datasheet.octopart.com:443/STMPS2151STR-STMicroelectronics-datasheet-502421.pdf?src-supplier=Future+Electronics
M10 = USB3320C-EZK: Microchip USB3320C-EZK; USB Transceiver; USB 2.0 at 480Mbit/s; 32-Pin QFN; Manufacturer Lifecycle Status: REL; Data Rate: 480Mbps; Dual Supply Voltage: 3.3V; ESD Protection: Yes; Frequency: 60MHz; Max Supply Voltage: 2V; Min Supply Voltage: 1.6V; Nominal Supply Current: 5.6mA; Number of Ports: 1; Supplier: DigiKey; Supplier Part Number: USB3320C-EZK-ND; Manufacturer: Microchip; Manufacturer Part Number: USB3320C-EZK; RoHS: Compliant; Category: USB Interface ICs; Stock: 28177; Pricing: 1=2.17, 25=1.8, 100=1.65 (USD); Projected EOL Date: 2034-06-12; Country of Assembly: Singapore, Taiwan; Country of Fabrication: United States of America; Country of Origin: Singapore, Taiwan; Export Control Classification Number (ECCN) Code: EAR99; Height: 900µm; HS Code: 8542.39.0090; Harmonized Tariff Schedule (HTS) Code: 8542.31.0030; Lead Free: Lead Free; Length: 5mm; Lifecycle Status: Production; Max Operating Temperature: 85°C; Min Operating Temperature: -40°C; Mounting Technology: Surface Mount; Pins: 32; Number of Transceivers: 1; Operating Supply Current: 5.6mA; Operating Supply Voltage: 3.3V; Packaging: Cut Tape; Radiation Hardening: No; REACH SVHC: No; Schedule B: 8542310000, 8542310000|8542310000|8542310000|8542310000|8542310000; Width: 5mm; ComponentLink1URL: https://datasheet.octopart.com:443/USB3320C-EZK-Microchip-datasheet-78862040.pdf?src-supplier=Microchip; ComponentLink1Description: https://datasheet.octopart.com:443/USB3320C-EZK-Microchip-datasheet-78862040.pdf?src-supplier=Microchip; ComponentLink2URL: https://datasheet.octopart.com:443/USB3320C-EZK-Microchip-datasheet-179437581.pdf?src-supplier=Microchip; ComponentLink2Description: https://datasheet.octopart.com:443/USB3320C-EZK-Microchip-datasheet-179437581.pdf?src-supplier=Microchip; ComponentLink3URL: https://datasheet.octopart.com:443/USB3320C-EZK-Microchip-datasheet-175859481.pdf?src-supplier=Microchip; ComponentLink3Description: https://datasheet.octopart.com:443/USB3320C-EZK-Microchip-datasheet-175859481.pdf?src-supplier=Microchip; ComponentLink4URL: https://datasheet.octopart.com:443/USB3320C-EZK-Microchip-datasheet-11971509.pdf?src-supplier=Arrow+Electronics; ComponentLink4Description: https://datasheet.octopart.com:443/USB3320C-EZK-Microchip-datasheet-11971509.pdf?src-supplier=Arrow+Electronics; ComponentLink5URL: https://datasheet.octopart.com:443/USB3320C-EZK-Microchip-datasheet-44328528.pdf?src-supplier=element14+APAC; ComponentLink5Description: https://datasheet.octopart.com:443/USB3320C-EZK-Microchip-datasheet-44328528.pdf?src-supplier=element14+APAC; ComponentLink6URL: https://datasheet.octopart.com:443/USB3320C-EZK-Microchip-datasheet-62308171.pdf?src-supplier=RS+(Formerly+Allied+Electronics); ComponentLink6Description: https://datasheet.octopart.com:443/USB3320C-EZK-Microchip-datasheet-62308171.pdf?src-supplier=RS+(Formerly+Allied+Electronics); ComponentLink7URL: http://sigma.octopart.com:80/188451864/materials_sheet/Microchip-USB3320C-EZK.pdf?src-supplier=Compliance+Statements; ComponentLink7Description: http://sigma.octopart.com:80/188451864/materials_sheet/Microchip-USB3320C-EZK.pdf?src-supplier=Compliance+Statements; ComponentLink8URL: http://sigma.octopart.com:80/rohs_statement/Microchip-company-71.pdf?src-supplier=Compliance+Statements; ComponentLink8Description: http://sigma.octopart.com:80/rohs_statement/Microchip-company-71.pdf?src-supplier=Compliance+Statements; ComponentLink9URL: http://sigma.octopart.com:80/reach_statement/Microchip-company-70.pdf?src-supplier=Compliance+Statements; ComponentLink9Description: http://sigma.octopart.com:80/reach_statement/Microchip-company-70.pdf?src-supplier=Compliance+Statements; ComponentLink10URL: http://sigma.octopart.com:80/conflict_mineral_statement/Microchip-company-69.pdf?src-supplier=Compliance+Statements; ComponentLink10Description: http://sigma.octopart.com:80/conflict_mineral_statement/Microchip-company-69.pdf?src-supplier=Compliance+Statements; ComponentLink11URL: http://sigma.octopart.com:80/conflict_mineral_statement/Microchip-company-68.pdf?src-supplier=Compliance+Statements; ComponentLink11Description: http://sigma.octopart.com:80/conflict_mineral_statement/Microchip-company-68.pdf?src-supplier=Compliance+Statements